# Altium project Control Board V1.PrjPcb
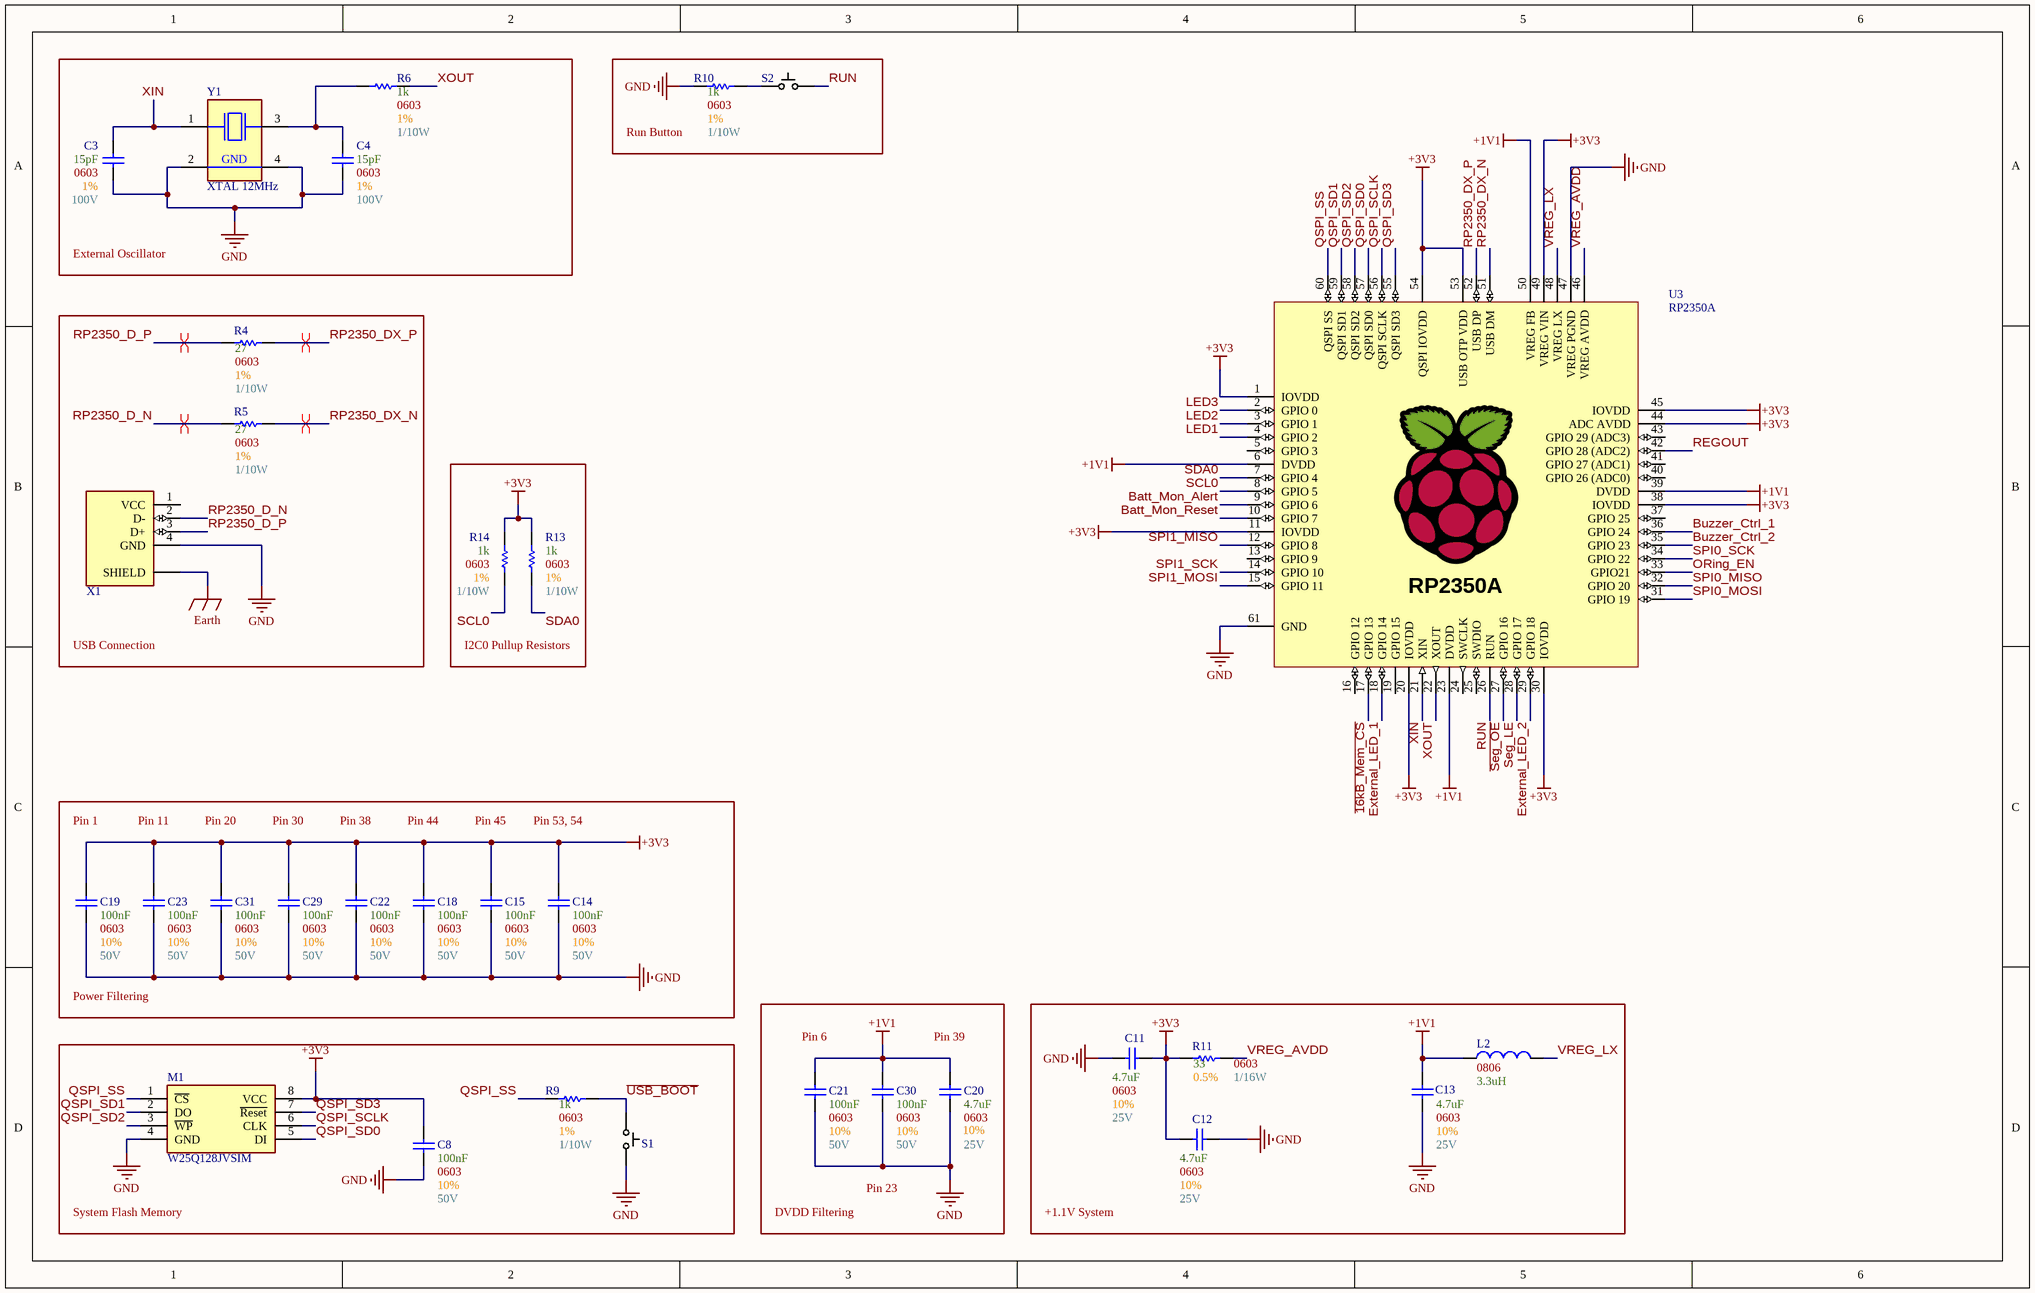
[diagram p0: RP2350.SchDoc]
5 sheets, 80 parts. Net scope: global (net labels, ports and power ports of the same name join across sheets).
Board file: Main.PcbDoc
Sheets:
  RP2350.SchDoc
  Connectors.SchDoc
  Battery Monitoring.SchDoc
  Power.SchDoc
  Misc Peripherals.SchDoc

## Sheet RP2350.SchDoc
size B; SheetNumber: 1; SheetTotal: 5

### Parts
C3  Max Voltage: 100V  Size Package: 0603  Tolerance: 1%  Capacitance: 15pF  [[Cap] SMD 0603]  (hidden comment: [Cap] 0603 15pF 1% 100V)
C4  Max Voltage: 100V  Size Package: 0603  Tolerance: 1%  Capacitance: 15pF  [[Cap] SMD 0603]  (hidden comment: [Cap] 0603 15pF 1% 100V)
C8  Max Voltage: 50V  Size Package: 0603  Tolerance: 10%  Capacitance: 100nF  [[Cap] SMD 0603]  (hidden comment: [Cap] 0603 0.1uF 10% 50V)
C11  Max Voltage: 25V  Size Package: 0603  Tolerance: 10%  Capacitance: 4.7uF  [[Cap] SMD 0603]  (hidden comment: [Cap] 0603 4.7uF 10% 25V)
C12  Max Voltage: 25V  Size Package: 0603  Tolerance: 10%  Capacitance: 4.7uF  [[Cap] SMD 0603]  (hidden comment: [Cap] 0603 4.7uF 10% 25V)
C13  Max Voltage: 25V  Size Package: 0603  Tolerance: 10%  Capacitance: 4.7uF  [[Cap] SMD 0603]  (hidden comment: [Cap] 0603 4.7uF 10% 25V)
C14  Max Voltage: 50V  Size Package: 0603  Tolerance: 10%  Capacitance: 100nF  [[Cap] SMD 0603]  (hidden comment: [Cap] 0603 0.1uF 10% 50V)
C15  Max Voltage: 50V  Size Package: 0603  Tolerance: 10%  Capacitance: 100nF  [[Cap] SMD 0603]  (hidden comment: [Cap] 0603 0.1uF 10% 50V)
C18  Max Voltage: 50V  Size Package: 0603  Tolerance: 10%  Capacitance: 100nF  [[Cap] SMD 0603]  (hidden comment: [Cap] 0603 0.1uF 10% 50V)
C19  Max Voltage: 50V  Size Package: 0603  Tolerance: 10%  Capacitance: 100nF  [[Cap] SMD 0603]  (hidden comment: [Cap] 0603 0.1uF 10% 50V)
C20  Max Voltage: 25V  Size Package: 0603  Tolerance: 10%  Capacitance: 4.7uF  [[Cap] SMD 0603]  (hidden comment: [Cap] 0603 4.7uF 10% 25V)
C21  Max Voltage: 50V  Size Package: 0603  Tolerance: 10%  Capacitance: 100nF  [[Cap] SMD 0603]  (hidden comment: [Cap] 0603 0.1uF 10% 50V)
C22  Max Voltage: 50V  Size Package: 0603  Tolerance: 10%  Capacitance: 100nF  [[Cap] SMD 0603]  (hidden comment: [Cap] 0603 0.1uF 10% 50V)
C23  Max Voltage: 50V  Size Package: 0603  Tolerance: 10%  Capacitance: 100nF  [[Cap] SMD 0603]  (hidden comment: [Cap] 0603 0.1uF 10% 50V)
C29  Max Voltage: 50V  Size Package: 0603  Tolerance: 10%  Capacitance: 100nF  [[Cap] SMD 0603]  (hidden comment: [Cap] 0603 0.1uF 10% 50V)
C30  Max Voltage: 50V  Size Package: 0603  Tolerance: 10%  Capacitance: 100nF  [[Cap] SMD 0603]  (hidden comment: [Cap] 0603 0.1uF 10% 50V)
C31  Max Voltage: 50V  Size Package: 0603  Tolerance: 10%  Capacitance: 100nF  [[Cap] SMD 0603]  (hidden comment: [Cap] 0603 0.1uF 10% 50V)
L2  Package: 0806  Inductance: 3.3uH  [[Inductor] SMD 0806]  (hidden comment: [3.3uH] SMD 0806 2.1A)
M1  W25Q128JVSIM  [[Flash] 128MBit]
R4  Wattage: 1/10W  Tolerance: 1%  Resistance: 27  Size Package: 0603  [[Res] SMD 0603]  (hidden comment: [27] SMD 0603 1% 1/10W)
R5  Wattage: 1/10W  Tolerance: 1%  Resistance: 27  Size Package: 0603  [[Res] SMD 0603]  (hidden comment: [27] SMD 0603 1% 1/10W)
R6  Wattage: 1/10W  Tolerance: 1%  Resistance: 1k  Size Package: 0603  [[Res] SMD 0603]  (hidden comment: [1k] SMD 0603 1% 1/10W)
R9  Wattage: 1/10W  Tolerance: 1%  Resistance: 1k  Size Package: 0603  [[Res] SMD 0603]  (hidden comment: [1k] SMD 0603 1% 1/10W)
R10  Wattage: 1/10W  Tolerance: 1%  Resistance: 1k  Size Package: 0603  [[Res] SMD 0603]  (hidden comment: [1k] SMD 0603 1% 1/10W)
R11  Wattage: 1/16W  Tolerance: 0.5%  Resistance: 33  Size Package: 0603  [[Res] SMD 0603]  (hidden comment: [33] SMD 0603 0.5% 1/16W)
R13  Wattage: 1/10W  Tolerance: 1%  Resistance: 1k  Size Package: 0603  [[Res] SMD 0603]  (hidden comment: [1k] SMD 0603 1% 1/10W)
R14  Wattage: 1/10W  Tolerance: 1%  Resistance: 1k  Size Package: 0603  [[Res] SMD 0603]  (hidden comment: [1k] SMD 0603 1% 1/10W)
S1  [SPST] SMD Pushbutton  [[SPST] SMD Pushbutton]  (value not drawn)
S2  [SPST] SMD Pushbutton  [[SPST] SMD Pushbutton]  (value not drawn)
U3  RP2350A  [[MCU] RP2350A]
X1  USB-B-S-VT  [[USB] Type-B Vertical]  (value not drawn)
Y1  XTAL 12MHz  [[Crystal] SMD 12MHz]

### Blocks framed on the sheet
External Oscillator: C3 C4 R6 Y1
Run Button: R10 S2
USB Connection: R4 R5 X1
I2C0 Pullup Resistors: R13 R14
+1.1V System: C11-C13 L2 R11
System Flash Memory: C8 M1 R9 S1

### Nets
+1V1: C13.1 C20.2 C21.2 C30.2 L2.1 U3.6(DVDD) U3.23(DVDD) U3.39(DVDD) U3.50(VREG_FB)
+3V3: C8.2 C11.1 C12.2 C14.2 C15.2 C18.2 C19.2 C22.2 C23.2 C29.2 C31.2 M1.8(VCC) R11.1 R13.2 R14.2 U3.1(IOVDD) U3.11(IOVDD) U3.20(IOVDD) U3.30(IOVDD) U3.38(IOVDD) U3.44(ADC_AVDD) U3.45(IOVDD) U3.49(VREG_VIN) U3.53(USB_OTP_VDD) U3.54(QSPI_IOVDD)
Earth: X1.MH(SHIELD)
GND: C3.1 C4.1 C8.1 C11.2 C12.1 C13.2 C14.1 C15.1 C18.1 C19.1 C20.1 C21.1 C22.1 C23.1 C29.1 C30.1 C31.1 M1.4(GND) R10.1 S1.2 U3.47(VREG_PGND) U3.61(GND) X1.4(GND) Y1.2(GND) Y1.4(GND)
~{16kB_Mem_CS}: U3.17(GPIO_13)
~{Seg_OE}: U3.27(GPIO_16)
Batt_Mon_Alert: U3.9(GPIO_6)
Batt_Mon_Reset: U3.10(GPIO_7)
Buzzer_Ctrl_1: U3.36(GPIO_24)
Buzzer_Ctrl_2: U3.35(GPIO_23)
External_LED_1: U3.18(GPIO_14)
External_LED_2: U3.29(GPIO_18)
LED1: U3.4(GPIO_2)
LED2: U3.3(GPIO_1)
LED3: U3.2(GPIO_0)
ORing_EN: U3.33(GPIO21)
QSPI_SCLK: M1.6(CLK) U3.56(QSPI_SCLK)
QSPI_SD0: M1.5(DI) U3.57(QSPI_SD0)
QSPI_SD1: M1.2(DO) U3.59(QSPI_SD1)
QSPI_SD2: M1.3(~{WP}) U3.58(QSPI_SD2)
QSPI_SD3: M1.7(~{Reset}) U3.55(QSPI_SD3)
QSPI_SS: M1.1(~{CS}) R9.1 U3.60(QSPI_SS)
REGOUT: U3.42(GPIO_28_(ADC2))
RP2350_D_N: R5.1 X1.2(D-)
RP2350_D_P: R4.1 X1.3(D+)
RP2350_DX_N: R5.2 U3.51(USB_DM)
RP2350_DX_P: R4.2 U3.52(USB_DP)
RUN: S2.2 U3.26(RUN)
SCL0: R14.1 U3.8(GPIO_5)
SDA0: R13.1 U3.7(GPIO_4)
Seg_LE: U3.28(GPIO_17)
SPI0_MISO: U3.32(GPIO_20)
SPI0_MOSI: U3.31(GPIO_19)
SPI0_SCK: U3.34(GPIO_22)
SPI1_MISO: U3.12(GPIO_8)
SPI1_MOSI: U3.15(GPIO_11)
SPI1_SCK: U3.14(GPIO_10)
~{USB_BOOT}: R9.2 S1.1
VREG_AVDD: R11.2 U3.46(VREG_AVDD)
VREG_LX: L2.2 U3.48(VREG_LX)
XIN: C3.2 U3.21(XIN) Y1.1(XTAL1)
XOUT: R6.2 U3.22(XOUT)
NetC4_2: C4.2 R6.1 Y1.3(XTAL2)
NetR10_2: R10.2 S2.1

Not connected (* = marked no-connect by the designer): U3 5(GPIO_3) 13(GPIO_9) 16(GPIO_12) 19(GPIO_15) 24(SWCLK) 25(SWDIO) 37(GPIO_25) 40(GPIO_26_(ADC0)) 41(GPIO_27_(ADC1)) 43(GPIO_29_(ADC3)); X1 1(VCC)

### Layout directives
differential pair; differential pair class USB_Pairs: RP2350_D_N, RP2350_D_P, RP2350_DX_N, RP2350_DX_P

### Notes on the sheet
- Pin 1
- Pin 11
- Pin 20
- Pin 30
- Pin 38
- Pin 44
- Pin 45
- Pin 53, 54
- Power Filtering
- (near C21) Pin 6
- Pin 39
- Pin 23
- DVDD Filtering

### Library data of the parts
C3 C4 = [Cap] 0603 15pF 1% 100V: GCM1885C2A150FA16D; Supplier 1: DigiKey; Supplier Part Number 1: 490-16416-1-ND
C8 C14 C15 C18 C19 C21-C23 C29-C31 = [Cap] 0603 0.1uF 10% 50V: CL10B104KB8NNNC; Supplier 1: DigiKey; Supplier Part Number 1: 1276-1000-6-ND
C11-C13 C20 = [Cap] 0603 4.7uF 10% 25V: GRM188R61E475KE11D; Supplier 1: DigiKey; Supplier Part Number 1: 490-7203-6-ND
L2 = [3.3uH] SMD 0806 2.1A: AOTA-B201610S3R3-101-T; Supplier 1: DigiKey; Supplier Part Number 1: 535-AOTA-B201610S3R3-101-TCT-ND
M1 = [Flash] 128MBit: Supplier 1: DigiKey; Supplier Part Number 1: W25Q128JVSIM-ND
R4 R5 = [27] SMD 0603 1% 1/10W: MCT06030C2709FP500; Supplier 1: DigiKey; Supplier Part Number 1: 749-1631-1-ND
R6 R9 R10 R13 R14 = [1k] SMD 0603 1% 1/10W: RMCF0603FT1K00; Supplier 1: DigiKey; Supplier Part Number 1: RMCF0603FT1K00DKR-ND
R11 = [33] SMD 0603 0.5% 1/16W: RR0816Q-330-D; Supplier 1: DigiKey; Supplier Part Number 1: RR08Q33DDKR-ND
S1 S2 = [SPST] SMD Pushbutton: PTS815SJM250SMTRLFS; Supplier 1: DigiKey; Supplier Part Number 1: CKN12215-6-ND
U3 = [MCU] RP2350A: QFN-60 Package; Supplier 1: DigiKey; Supplier Part Number 1: 2648-SC1509-A4CT-ND
X1 = [USB] Type-B Vertical: Supplier 1: DigiKey; Supplier Part Number 1: 2057-USB-B-S-VT-ND
Y1 = [Crystal] SMD 12MHz: 815-ABM8-272-T3; Supplier 1: DigiKey; Supplier Part Number 1: 535-ABM8-272-T3CT-ND

## Sheet Connectors.SchDoc
size A; SheetNumber: 2; SheetTotal: 5
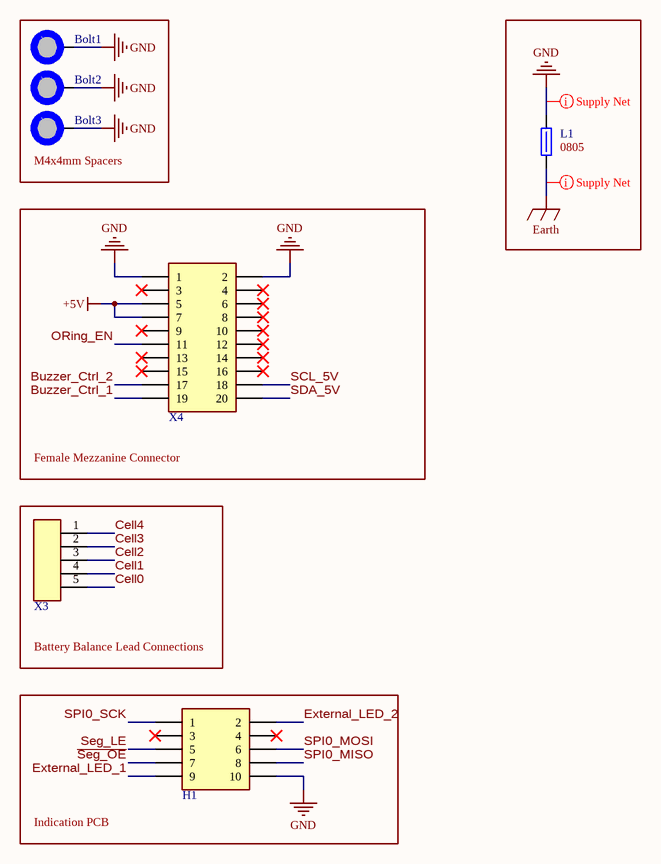
[diagram p1: Connectors.SchDoc]

### Parts
Bolt1  M4 4mm Spacer  [[Bolt] M4 len=4mm OD=6mm Spacer]  (value not drawn)
Bolt2  M4 4mm Spacer  [[Bolt] M4 len=4mm OD=6mm Spacer]  (value not drawn)
Bolt3  M4 4mm Spacer  [[Bolt] M4 len=4mm OD=6mm Spacer]  (value not drawn)
H1  2x5 Shrouded  [[Rectangular] Shrouded 2x5 Male]  (value not drawn)
L1  Size Package: 0805  [[Ferrite] SMD 0805]  (hidden comment: 652-MH2029-300Y)
X3  [JST] 5pin 90deg 2.54mm pitch  [[JST] 5pin 90deg 2.54mm pitch]  (value not drawn)
X4  [Mezzanine] 20pin H=4.0mm  [[Mezzanine] 20pin H=4.0mm Male]  (value not drawn)

### Blocks framed on the sheet
M4x4mm Spacers: Bolt1-Bolt3
Female Mezzanine Connector: X4
Battery Balance Lead Connections: X3
Indication PCB: H1

### Nets
+5V: X4.5 X4.7
Earth: L1.1
GND: Bolt1.1 Bolt2.1 Bolt3.1 H1.10 L1.2 X4.1 X4.2
~{Seg_OE}: H1.7
Buzzer_Ctrl_1: X4.19
Buzzer_Ctrl_2: X4.17
Cell0: X3.5
Cell1: X3.4
Cell2: X3.3
Cell3: X3.2
Cell4: X3.1
External_LED_1: H1.9
External_LED_2: H1.2
ORing_EN: X4.11
SCL_5V: X4.18
SDA_5V: X4.20
Seg_LE: H1.5
SPI0_MISO: H1.8
SPI0_MOSI: H1.6
SPI0_SCK: H1.1

Not connected (* = marked no-connect by the designer): H1 3* 4*; X4 3* 4* 6* 8* 9* 10* 12* 13* 14* 15* 16*

### Layout directives
net class Supply_Nets: Earth, GND

### Library data of the parts
Bolt1-Bolt3 = [Bolt] M4 len=4mm OD=6mm Spacer: ID: 4mm / OD: 6mm; ComponentLink1Description: McMaster Supplier; ComponentLink1URL: https://www.mcmaster.com/94669A006/
H1 = [Rectangular] Shrouded 2x5 Male: BHR-10-VUA; System: Connector; Supplier 1: DigiKey; Supplier Part Number 1: 2057-BHR-10-VUA-ND
L1 = [Ferrite] SMD 0805 3A 30ohm: Res @ Freq: 30 @ 100MHz; Supplier 1: DigiKey; Supplier Part Number 1: MH2029-300YCT-ND
X4 = [Mezzanine] 20pin H=4.0mm: DF40TC(4.0)-20DS-0.4V(58); System: Connector; Supplier 1: DigiKey; Supplier Part Number 1: 26-DF40TC(4.0)-20DS-0.4V(58)CT-ND

## Sheet Battery Monitoring.SchDoc
size A; SheetNumber: 3; SheetTotal: 5
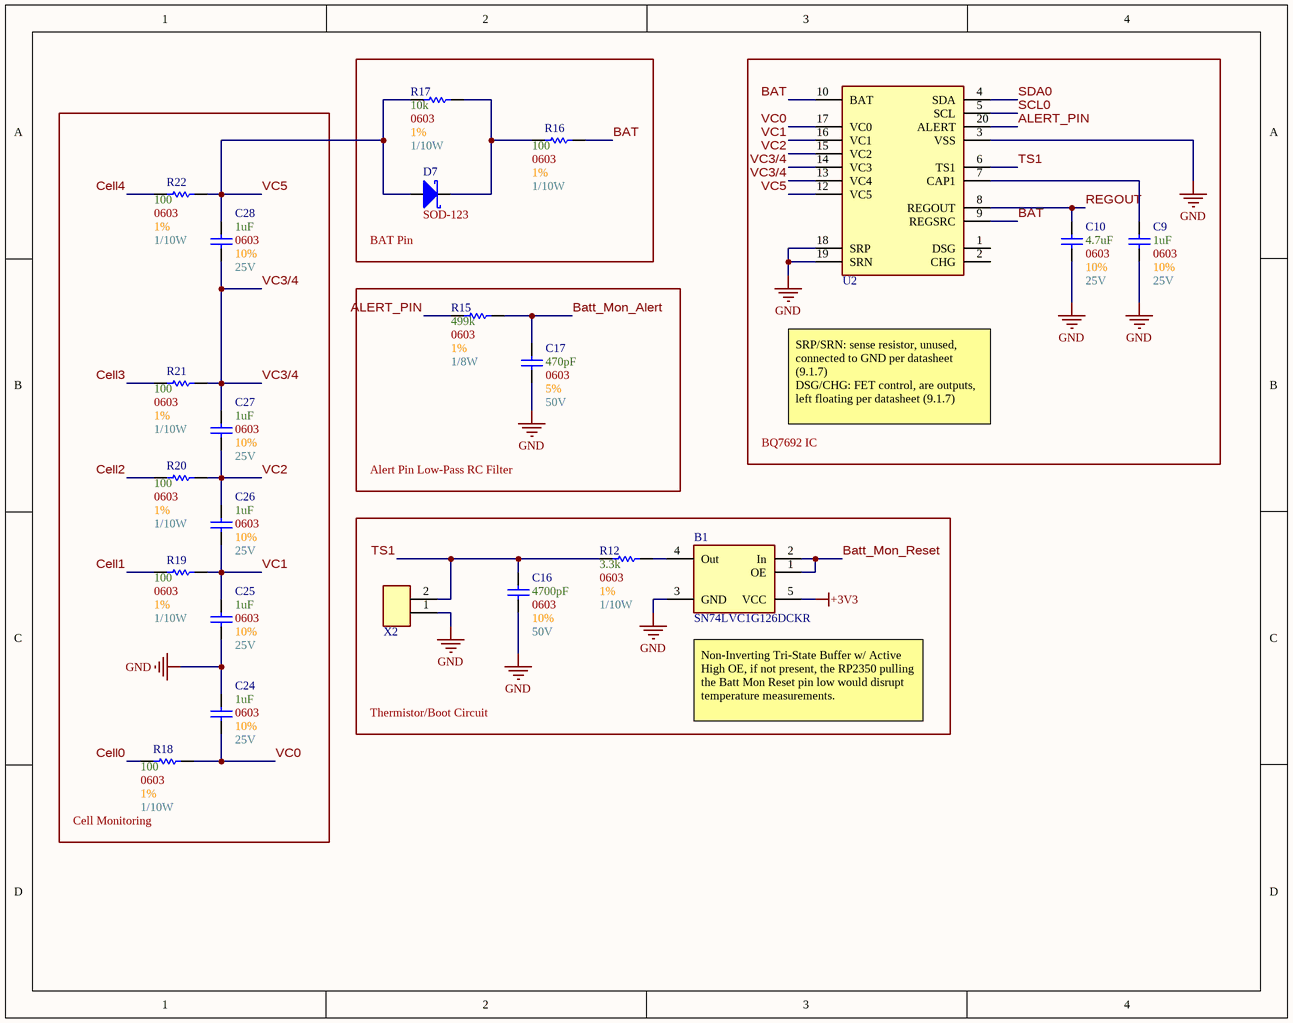
[diagram p2: Battery Monitoring.SchDoc]

### Parts
B1  SN74LVC1G126DCKR  [5-TSSOP, SC-70-5, SOT-353]
C9  Max Voltage: 25V  Size Package: 0603  Tolerance: 10%  Capacitance: 1uF  [[Cap] SMD 0603]  (hidden comment: [Cap] 0603 1uF 10% 25V)
C10  Max Voltage: 25V  Size Package: 0603  Tolerance: 10%  Capacitance: 4.7uF  [[Cap] SMD 0603]  (hidden comment: [Cap] 0603 4.7uF 10% 25V)
C16  Max Voltage: 50V  Size Package: 0603  Tolerance: 10%  Capacitance: 4700pF  [[Cap] SMD 0603]  (hidden comment: [Cap] 0603 4700pF 10% 50V)
C17  Max Voltage: 50V  Size Package: 0603  Tolerance: 5%  Capacitance: 470pF  [[Cap] SMD 0603]  (hidden comment: [Cap] 0603 470pF 5% 50V)
C24  Max Voltage: 25V  Size Package: 0603  Tolerance: 10%  Capacitance: 1uF  [[Cap] SMD 0603]  (hidden comment: [Cap] 0603 1uF 10% 25V)
C25  Max Voltage: 25V  Size Package: 0603  Tolerance: 10%  Capacitance: 1uF  [[Cap] SMD 0603]  (hidden comment: [Cap] 0603 1uF 10% 25V)
C26  Max Voltage: 25V  Size Package: 0603  Tolerance: 10%  Capacitance: 1uF  [[Cap] SMD 0603]  (hidden comment: [Cap] 0603 1uF 10% 25V)
C27  Max Voltage: 25V  Size Package: 0603  Tolerance: 10%  Capacitance: 1uF  [[Cap] SMD 0603]  (hidden comment: [Cap] 0603 1uF 10% 25V)
C28  Max Voltage: 25V  Size Package: 0603  Tolerance: 10%  Capacitance: 1uF  [[Cap] SMD 0603]  (hidden comment: [Cap] 0603 1uF 10% 25V)
D7  Footprint: SOD-123  [[Diode] SMD SOD-123]  (hidden comment: SOD123)
R12  Wattage: 1/10W  Tolerance: 1%  Resistance: 3.3k  Size Package: 0603  [[Res] SMD 0603]  (hidden comment: [3.3k] SMD 0603 1% 1/10W)
R15  Wattage: 1/8W  Tolerance: 1%  Resistance: 499k  Size Package: 0603  [[Res] SMD 0603]  (hidden comment: [499k] SMD 0603 1% 1/8W)
R16  Wattage: 1/10W  Tolerance: 1%  Resistance: 100  Size Package: 0603  [[Res] SMD 0603]  (hidden comment: [100] SMD 0603 1% 1/10W)
R17  Wattage: 1/10W  Tolerance: 1%  Resistance: 10k  Size Package: 0603  [[Res] SMD 0603]  (hidden comment: [10k] SMD 0603 1% 1/10W)
R18  Wattage: 1/10W  Tolerance: 1%  Resistance: 100  Size Package: 0603  [[Res] SMD 0603]  (hidden comment: [100] SMD 0603 1% 1/10W)
R19  Wattage: 1/10W  Tolerance: 1%  Resistance: 100  Size Package: 0603  [[Res] SMD 0603]  (hidden comment: [100] SMD 0603 1% 1/10W)
R20  Wattage: 1/10W  Tolerance: 1%  Resistance: 100  Size Package: 0603  [[Res] SMD 0603]  (hidden comment: [100] SMD 0603 1% 1/10W)
R21  Wattage: 1/10W  Tolerance: 1%  Resistance: 100  Size Package: 0603  [[Res] SMD 0603]  (hidden comment: [100] SMD 0603 1% 1/10W)
R22  Wattage: 1/10W  Tolerance: 1%  Resistance: 100  Size Package: 0603  [[Res] SMD 0603]  (hidden comment: [100] SMD 0603 1% 1/10W)
U2  [Batt Mon] 3-5 Cell BMS  [[Batt Mon] 3-5 Cell BMS]  (value not drawn)
X2  [Sherlock] 2pin  [[Sherlock] 2pin]  (value not drawn)

### Blocks framed on the sheet
BAT Pin: D7 R16 R17
BQ7692 IC: C9 C10 U2
Cell Monitoring: C24-C28 R18-R22
Alert Pin Low-Pass RC Filter: C17 R15
Thermistor/Boot Circuit: B1 C16 R12 X2

### Nets
+3V3: B1.5(VCC)
GND: B1.3(GND) C9.1 C10.1 C16.1 C17.1 C24.2 C25.1 U2.3(VSS) U2.18(SRP) U2.19(SRN) X2.1
ALERT_PIN: R15.1 U2.20(ALERT)
BAT: R16.2 U2.9(REGSRC) U2.10(BAT)
Batt_Mon_Alert: C17.2 R15.2
Batt_Mon_Reset: B1.1(OE) B1.2(In)
Cell0: R18.1
Cell1: R19.1
Cell2: R20.1
Cell3: R21.1
Cell4: R22.1
REGOUT: C10.2 U2.8(REGOUT)
SCL0: U2.5(SCL)
SDA0: U2.4(SDA)
TS1: C16.2 R12.2 U2.6(TS1) X2.2
VC0: C24.1 R18.2 U2.17(VC0)
VC1: C25.2 C26.1 R19.2 U2.16(VC1)
VC2: C26.2 C27.1 R20.2 U2.15(VC2)
VC3/4: C27.2 C28.1 R21.2 U2.13(VC4) U2.14(VC3)
VC5: C28.2 D7.2(A) R17.1 R22.2 U2.12(VC5)
NetB1_4: B1.4(Out) R12.1
NetC9_2: C9.2 U2.7(CAP1)
NetD7_1: D7.1(K) R16.1 R17.2

Not connected (* = marked no-connect by the designer): U2 1(DSG) 2(CHG)

### Notes on the sheet
- SRP/SRN: sense resistor, unused, connected to GND per datasheet (9.1.7)
  DSG/CHG: FET control, are outputs, left floating per datasheet (9.1.7)
- (near B1) Non-Inverting Tri-State Buffer w/ Active High OE, if not present, the RP2350 pulling the Batt Mon Reset pin low would disrupt temperature measurements.

### Library data of the parts
B1 = [Buffer] Single Tri-State Active-High OE: Supplier 1: DigiKey; Supplier Part Number 1: 296-11606-6-ND
C9 C24-C28 = [Cap] 0603 1uF 10% 25V: CL10B105KA8NNNC; Supplier 1: DigiKey; Supplier Part Number 1: 1276-1184-1-ND
C10 = [Cap] 0603 4.7uF 10% 25V: GRM188R61E475KE11D; Supplier 1: DigiKey; Supplier Part Number 1: 490-7203-6-ND
C16 = [Cap] 0603 4700pF 10% 50V: CL10B472KB8WPNC; Supplier 1: DigiKey; Supplier Part Number 1: 1276-6532-1-ND
C17 = [Cap] 0603 470pF 5% 50V: C0603C471J5GACTU; Supplier 1: DigiKey; Supplier Part Number 1: 399-C0603C471J5GACTUDKR-ND
D7 = [Schottky] SMD 40V 1A: B5819W-TP; Supplier 1: DigiKey; Supplier Part Number 1: B5819W-TPMSCT-ND
R12 = [3.3k] SMD 0603 1% 1/10W: RC0603FR-073K3L; Supplier 1: DigiKey; Supplier Part Number 1: 311-3.30KHRCT-ND
R15 = [499k] SMD 0603 1% 1/8W: CRCW0603499KFKEA; Supplier 1: DigiKey; Supplier Part Number 1: 541-499KHCT-ND
R16 R18-R22 = [100] SMD 0603 1% 1/10W: RC0603FR-07100RL; Supplier 1: DigiKey; Supplier Part Number 1: 311-100HRDKR-ND
R17 = [10k] SMD 0603 1% 1/10W: RMCF0603FT10K0; Supplier 1: DigiKey; Supplier Part Number 1: RMCF0603FT10K0DKR-ND
U2 = [Batt Mon] 3-5 Cell BMS: BQ7692006PWR; Supplier 1: DigiKey; Supplier Part Number 1: 296-39960-1-ND
X2 = [Sherlock] 2pin: 0353620250; Supplier 1: DigiKey; Supplier Part Number 1: WM18920-ND

## Sheet Power.SchDoc
size A; SheetNumber: 4; SheetTotal: 5
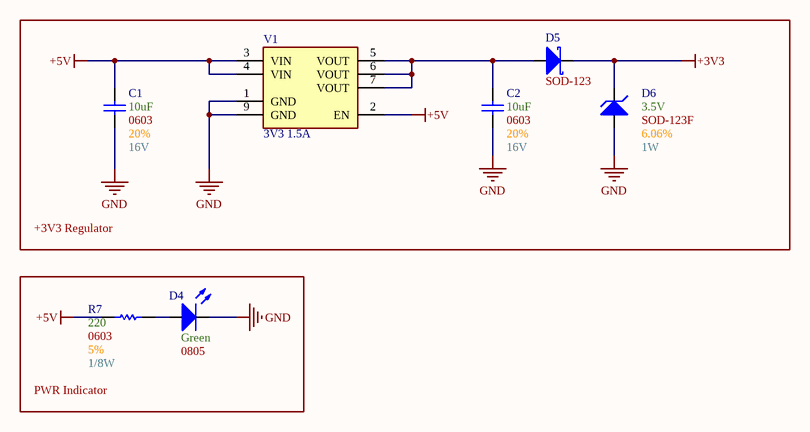
[diagram p3: Power.SchDoc]

### Parts
C1  Max Voltage: 16V  Size Package: 0603  Tolerance: 20%  Capacitance: 10uF  [[Cap] SMD 0603]  (hidden comment: [Cap] 0603 10uF 20% 16V)
C2  Max Voltage: 16V  Size Package: 0603  Tolerance: 20%  Capacitance: 10uF  [[Cap] SMD 0603]  (hidden comment: [Cap] 0603 10uF 20% 16V)
D4  Color: Green  Size Package: 0805  [[LED] SMD 0805]  (hidden comment: [LED] SMD 0805 Green)
D5  Footprint: SOD-123  [[Diode] SMD SOD-123]  (hidden comment: SOD123)
D6  Tolerance: 6.06%  Wattage: 1W  Optimal Zener Voltage: 3.5V  [[Diode] SOD-123F]  (hidden comment: SOD-123F)
R7  Wattage: 1/8W  Tolerance: 5%  Resistance: 220  Size Package: 0603  [[Res] SMD 0603]  (hidden comment: [220] SMD 0603 5% 1/10W)
V1  3V3 1.5A  [[Linear] 3V3 1.5A]

### Blocks framed on the sheet
+3V3 Regulator: C1 C2 D5 D6 V1
PWR Indicator: D4 R7

### Nets
+3V3: D5.1(K) D6.1(K)
+5V: C1.2 R7.1 V1.2(EN) V1.3(VIN) V1.4(VIN)
GND: C1.1 C2.1 D4.2(Cathode) D6.2(A) V1.1(GND) V1.9(GND)
NetC2_2: C2.2 D5.2(A) V1.5(VOUT) V1.6(VOUT) V1.7(VOUT)
NetD4_1: D4.1(Anode) R7.2

### Notes on the sheet
- (in symbol [Switching] SMD 0.8-10V 8A) VIN; VOUT; GNDs; CONFIG

### Library data of the parts
C1 C2 = [Cap] 0603 10uF 20% 16V: GRM188C81C106MA73D; Supplier 1: DigiKey; Supplier Part Number 1: 490-7198-1-ND
D4 = [LED] SMD 0805 Green: LG R971-KN-1-0-20-R18; Supplier 1: DigiKey; Supplier Part Number 1: 475-LGR971-KN-1CT-ND
D5 = [Schottky] SMD 40V 1A: B5819W-TP; Supplier 1: DigiKey; Supplier Part Number 1: B5819W-TPMSCT-ND
D6 = [Zener] SMD 3.5V 1W 6%: KDZVTR3.3B; Supplier 1: DigiKey; Supplier Part Number 1: 846-KDZVTR3.3BCT-ND; Footprint: SOD-123F
R7 = [220] SMD 0603 5% 1/10W: RK73B1JTTD221J; Supplier 1: DigiKey; Supplier Part Number 1: 2019-RK73B1JTTD221JDKR-ND
V1 = [Linear] SMD 3V3 1.5A: AP7362A-33SP-13; Supplier 1: DigiKey; Supplier Part Number 1: AP7362A-33SP-13DICT-ND

## Sheet Misc Peripherals.SchDoc
size A; SheetNumber: 5; SheetTotal: 5
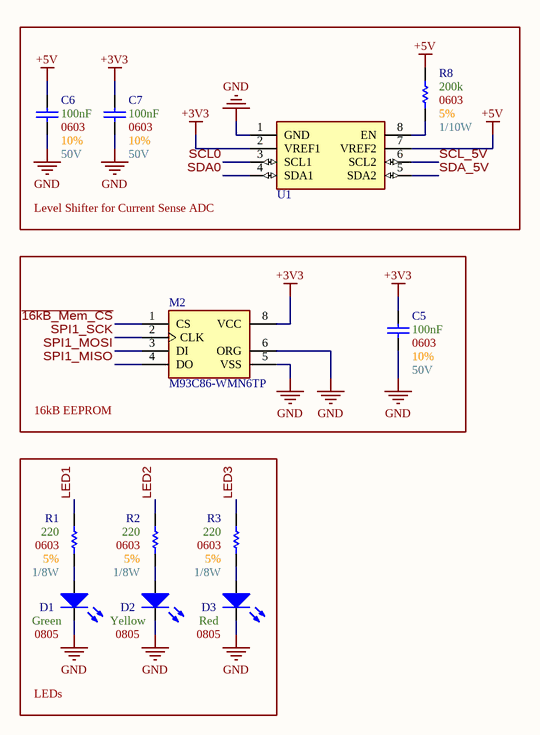
[diagram p4: Misc Peripherals.SchDoc]

### Parts
C5  Max Voltage: 50V  Size Package: 0603  Tolerance: 10%  Capacitance: 100nF  [[Cap] SMD 0603]  (hidden comment: [Cap] 0603 0.1uF 10% 50V)
C6  Max Voltage: 50V  Size Package: 0603  Tolerance: 10%  Capacitance: 100nF  [[Cap] SMD 0603]  (hidden comment: [Cap] 0603 0.1uF 10% 50V)
C7  Max Voltage: 50V  Size Package: 0603  Tolerance: 10%  Capacitance: 100nF  [[Cap] SMD 0603]  (hidden comment: [Cap] 0603 0.1uF 10% 50V)
D1  Color: Green  Size Package: 0805  [[LED] SMD 0805]  (hidden comment: [LED] SMD 0805 Green)
D2  Color: Yellow  Size Package: 0805  [[LED] SMD 0805]  (hidden comment: [LED] SMD 0805 Yellow)
D3  Color: Red  Size Package: 0805  [[LED] SMD 0805]  (hidden comment: [LED] SMD 0805 Red)
M2  M93C86-WMN6TP  [8-SOIC]
R1  Wattage: 1/8W  Tolerance: 5%  Resistance: 220  Size Package: 0603  [[Res] SMD 0603]  (hidden comment: [220] SMD 0603 5% 1/10W)
R2  Wattage: 1/8W  Tolerance: 5%  Resistance: 220  Size Package: 0603  [[Res] SMD 0603]  (hidden comment: [220] SMD 0603 5% 1/10W)
R3  Wattage: 1/8W  Tolerance: 5%  Resistance: 220  Size Package: 0603  [[Res] SMD 0603]  (hidden comment: [220] SMD 0603 5% 1/10W)
R8  Wattage: 1/10W  Tolerance: 5%  Resistance: 200k  Size Package: 0603  [[Res] SMD 0603]  (hidden comment: [200k] SMD 0603 1% 1/10W)
U1  [Level Shifter] I2C Level Shifter  [[Level Shifter] I2C Level Shifter]  (value not drawn)

### Blocks framed on the sheet
Level Shifter for Current Sense ADC: C6 C7 R8 U1
16kB EEPROM: C5 M2
LEDs: D1-D3 R1-R3

### Nets
+3V3: C5.2 C7.2 M2.8(VCC) U1.2(VREF1)
+5V: C6.2 R8.2 U1.7(VREF2)
GND: C5.1 C6.1 C7.1 D1.2(Cathode) D2.2(Cathode) D3.2(Cathode) M2.5(VSS) M2.6(ORG) U1.1(GND)
~{16kB_Mem_CS}: M2.1(CS)
LED1: R1.2
LED2: R2.2
LED3: R3.2
SCL0: U1.3(SCL1)
SCL_5V: U1.6(SCL2)
SDA0: U1.4(SDA1)
SDA_5V: U1.5(SDA2)
SPI1_MISO: M2.4(DO)
SPI1_MOSI: M2.3(DI)
SPI1_SCK: M2.2(CLK)
NetD1_1: D1.1(Anode) R1.1
NetD2_1: D2.1(Anode) R2.1
NetD3_1: D3.1(Anode) R3.1
NetR8_1: R8.1 U1.8(EN)

### Library data of the parts
C5-C7 = [Cap] 0603 0.1uF 10% 50V: CL10B104KB8NNNC; Supplier 1: DigiKey; Supplier Part Number 1: 1276-1000-6-ND
D1 = [LED] SMD 0805 Green: LG R971-KN-1-0-20-R18; Supplier 1: DigiKey; Supplier Part Number 1: 475-LGR971-KN-1CT-ND
D2 = [LED] SMD 0805 Yellow: LY R976-PS-36-0-20-R18; Supplier 1: DigiKey; Supplier Part Number 1: 475-LYR976-PS-36-0-20-R18CT-ND
D3 = [LED] SMD 0805 Red: LS R976-NR-1-0-20-R18; Supplier 1: DigiKey; Supplier Part Number 1: 475-LSR976-NR-1CT-ND
M2 = [Flash] 16kb: Supplier 1: DigiKey; Supplier Part Number 1: 497-8665-1-ND
R1-R3 = [220] SMD 0603 5% 1/10W: RK73B1JTTD221J; Supplier 1: DigiKey; Supplier Part Number 1: 2019-RK73B1JTTD221JDKR-ND
R8 = [200k] SMD 0603 1% 1/10W: RC0603JR-07200KL; Supplier 1: DigiKey; Supplier Part Number 1: 311-200KGRCT-ND
U1 = [Level Shifter] I2C Level Shifter: PCA9306DCTR; Supplier 1: DigiKey; Supplier Part Number 1: 296-18509-1-ND

## Nets that join several sheets
+3V3: RP2350 (25 pins), Battery Monitoring (B1.5), Power (D5.1 D6.1), Misc Peripherals (C5.2 C7.2 M2.8 U1.2)
+5V: Connectors (X4.5 X4.7), Power (5 pins), Misc Peripherals (C6.2 R8.2 U1.7)
Earth: RP2350 (X1.MH), Connectors (L1.1)
GND: RP2350 (25 pins), Connectors (7 pins), Battery Monitoring (11 pins), Power (6 pins), Misc Peripherals (9 pins)
~{16kB_Mem_CS}: RP2350 (U3.17), Misc Peripherals (M2.1)
~{Seg_OE}: RP2350 (U3.27), Connectors (H1.7)
Batt_Mon_Alert: RP2350 (U3.9), Battery Monitoring (C17.2 R15.2)
Batt_Mon_Reset: RP2350 (U3.10), Battery Monitoring (B1.1 B1.2)
Buzzer_Ctrl_1: RP2350 (U3.36), Connectors (X4.19)
Buzzer_Ctrl_2: RP2350 (U3.35), Connectors (X4.17)
Cell0: Connectors (X3.5), Battery Monitoring (R18.1)
Cell1: Connectors (X3.4), Battery Monitoring (R19.1)
Cell2: Connectors (X3.3), Battery Monitoring (R20.1)
Cell3: Connectors (X3.2), Battery Monitoring (R21.1)
Cell4: Connectors (X3.1), Battery Monitoring (R22.1)
External_LED_1: RP2350 (U3.18), Connectors (H1.9)
External_LED_2: RP2350 (U3.29), Connectors (H1.2)
LED1: RP2350 (U3.4), Misc Peripherals (R1.2)
LED2: RP2350 (U3.3), Misc Peripherals (R2.2)
LED3: RP2350 (U3.2), Misc Peripherals (R3.2)
ORing_EN: RP2350 (U3.33), Connectors (X4.11)
REGOUT: RP2350 (U3.42), Battery Monitoring (C10.2 U2.8)
SCL0: RP2350 (R14.1 U3.8), Battery Monitoring (U2.5), Misc Peripherals (U1.3)
SCL_5V: Connectors (X4.18), Misc Peripherals (U1.6)
SDA0: RP2350 (R13.1 U3.7), Battery Monitoring (U2.4), Misc Peripherals (U1.4)
SDA_5V: Connectors (X4.20), Misc Peripherals (U1.5)
Seg_LE: RP2350 (U3.28), Connectors (H1.5)
SPI0_MISO: RP2350 (U3.32), Connectors (H1.8)
SPI0_MOSI: RP2350 (U3.31), Connectors (H1.6)
SPI0_SCK: RP2350 (U3.34), Connectors (H1.1)
SPI1_MISO: RP2350 (U3.12), Misc Peripherals (M2.4)
SPI1_MOSI: RP2350 (U3.15), Misc Peripherals (M2.3)
SPI1_SCK: RP2350 (U3.14), Misc Peripherals (M2.2)